# Altium schematic sheet Sheet1.SchDoc
size A
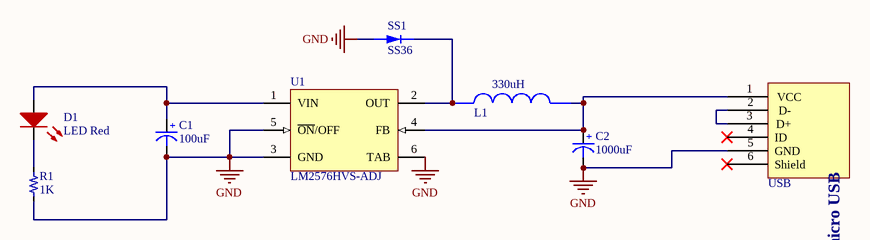
[diagram p0: Sheet1.SchDoc]

## Parts
C1  100uF  [ELEC-CAP-RAD10-20]
C2  1000uF  [ELEC-CAP-RAD20-40]
D1  LED Red  [LED_Red_1206]
L1  330uH  [RH127]
R1  1K  [Res_1206_SMD]
SS1  SS36  [SS36]
U1  LM2576HVS-ADJ  [TS5B_M]
USB  USB  [USB A-FEMALE]  (value not drawn)

## Nets
GND: C1.1(-) C2.1(-) R1.2 SS1.1(Anode) U1.3(GND) U1.5(~{ON}/OFF) U1.6(TAB) USB.5(GND)
NetC1_2: C1.2(+) D1.1(A) U1.1(VIN)
NetC2_2: C2.2(+) L1.2 U1.4(FB) USB.1(VCC)
NetD1_2: D1.2(K) R1.1
NetL1_1: L1.1 SS1.2(Cathode) U1.2(OUT)
NetUSB_2: USB.2(D-) USB.3(D+)

Not connected (* = marked no-connect by the designer): USB 4(ID)* 6(Shield)*

## Notes on the sheet
- (in symbol USB) micro USB

## Library data of the parts
C1 C2 = Capacitor Electrolytic: Electrolytic Capacitor
L1 = Inductor
R1 = Resistor
U1 = LM2576HVS-ADJ: SIMPLE SWITCHER® 3A Step-Down Voltage Regulator, 5-pin TO-263; Manufacturer: National Semiconductor; PackageTopMarking: NSUZXYTTE#*LM2576*HVS-ADJ P+; PowerWise: N; Published: 4-Dec-2008; DatasheetVersion: Aug-2004; PackageVersion: revD, Apr-2005; PackageReference: TS5B; Publisher: Altium Limited; PackageDescription: TO-263, Molded, .400 x .390 x .180in, 5 Lead, .067in Pitch, Surface Mount; Supplier 1: Farnell; Supplier Part Number 1: 8207380; PartNumber: LM2576HVS-ADJ; RoHS: N; PinCount: 5; CompType: Switcher; Code_JEDEC: MO-169-AB; ComponentLink1Description: LM2576HV Datasheet; ComponentLink1URL: http://www.national.com/ds/LM/LM2576HV.pdf; ComponentLink2Description: LM2576HV Web Page; ComponentLink2URL: http://www.national.com/pf/LM/LM2576HV.html; ComponentLink3Description: TS5B Package Page; ComponentLink3URL: http://www.national.com/packaging/folders/ts5b.html